# EasyEDA Pro project ProPrj_国赛底层板子_2026-05-31.epro, board 1-PCB_pcb2
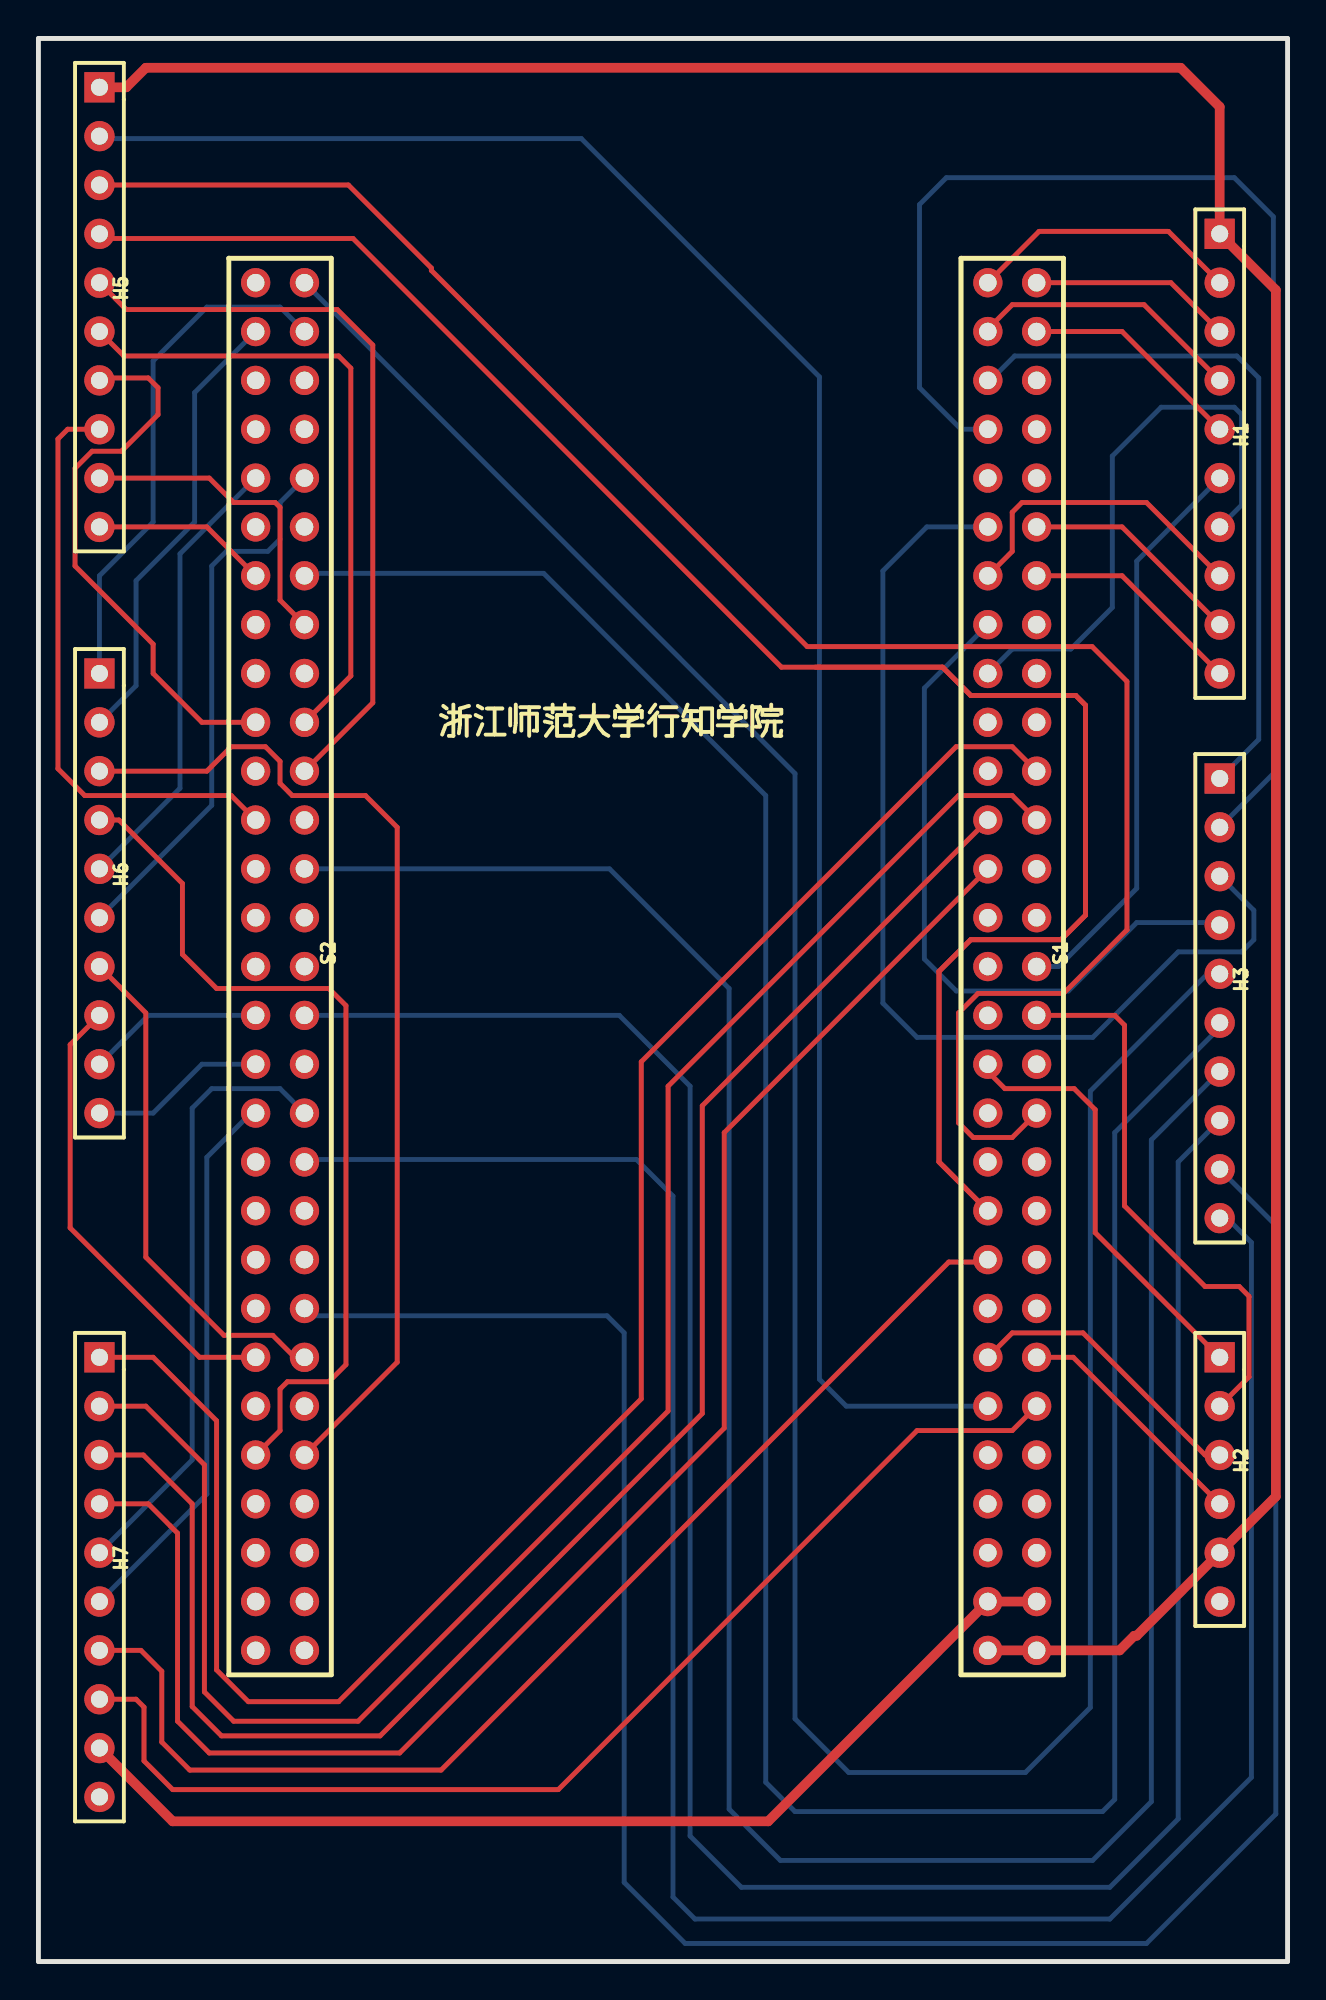
[diagram p9: board, top side]
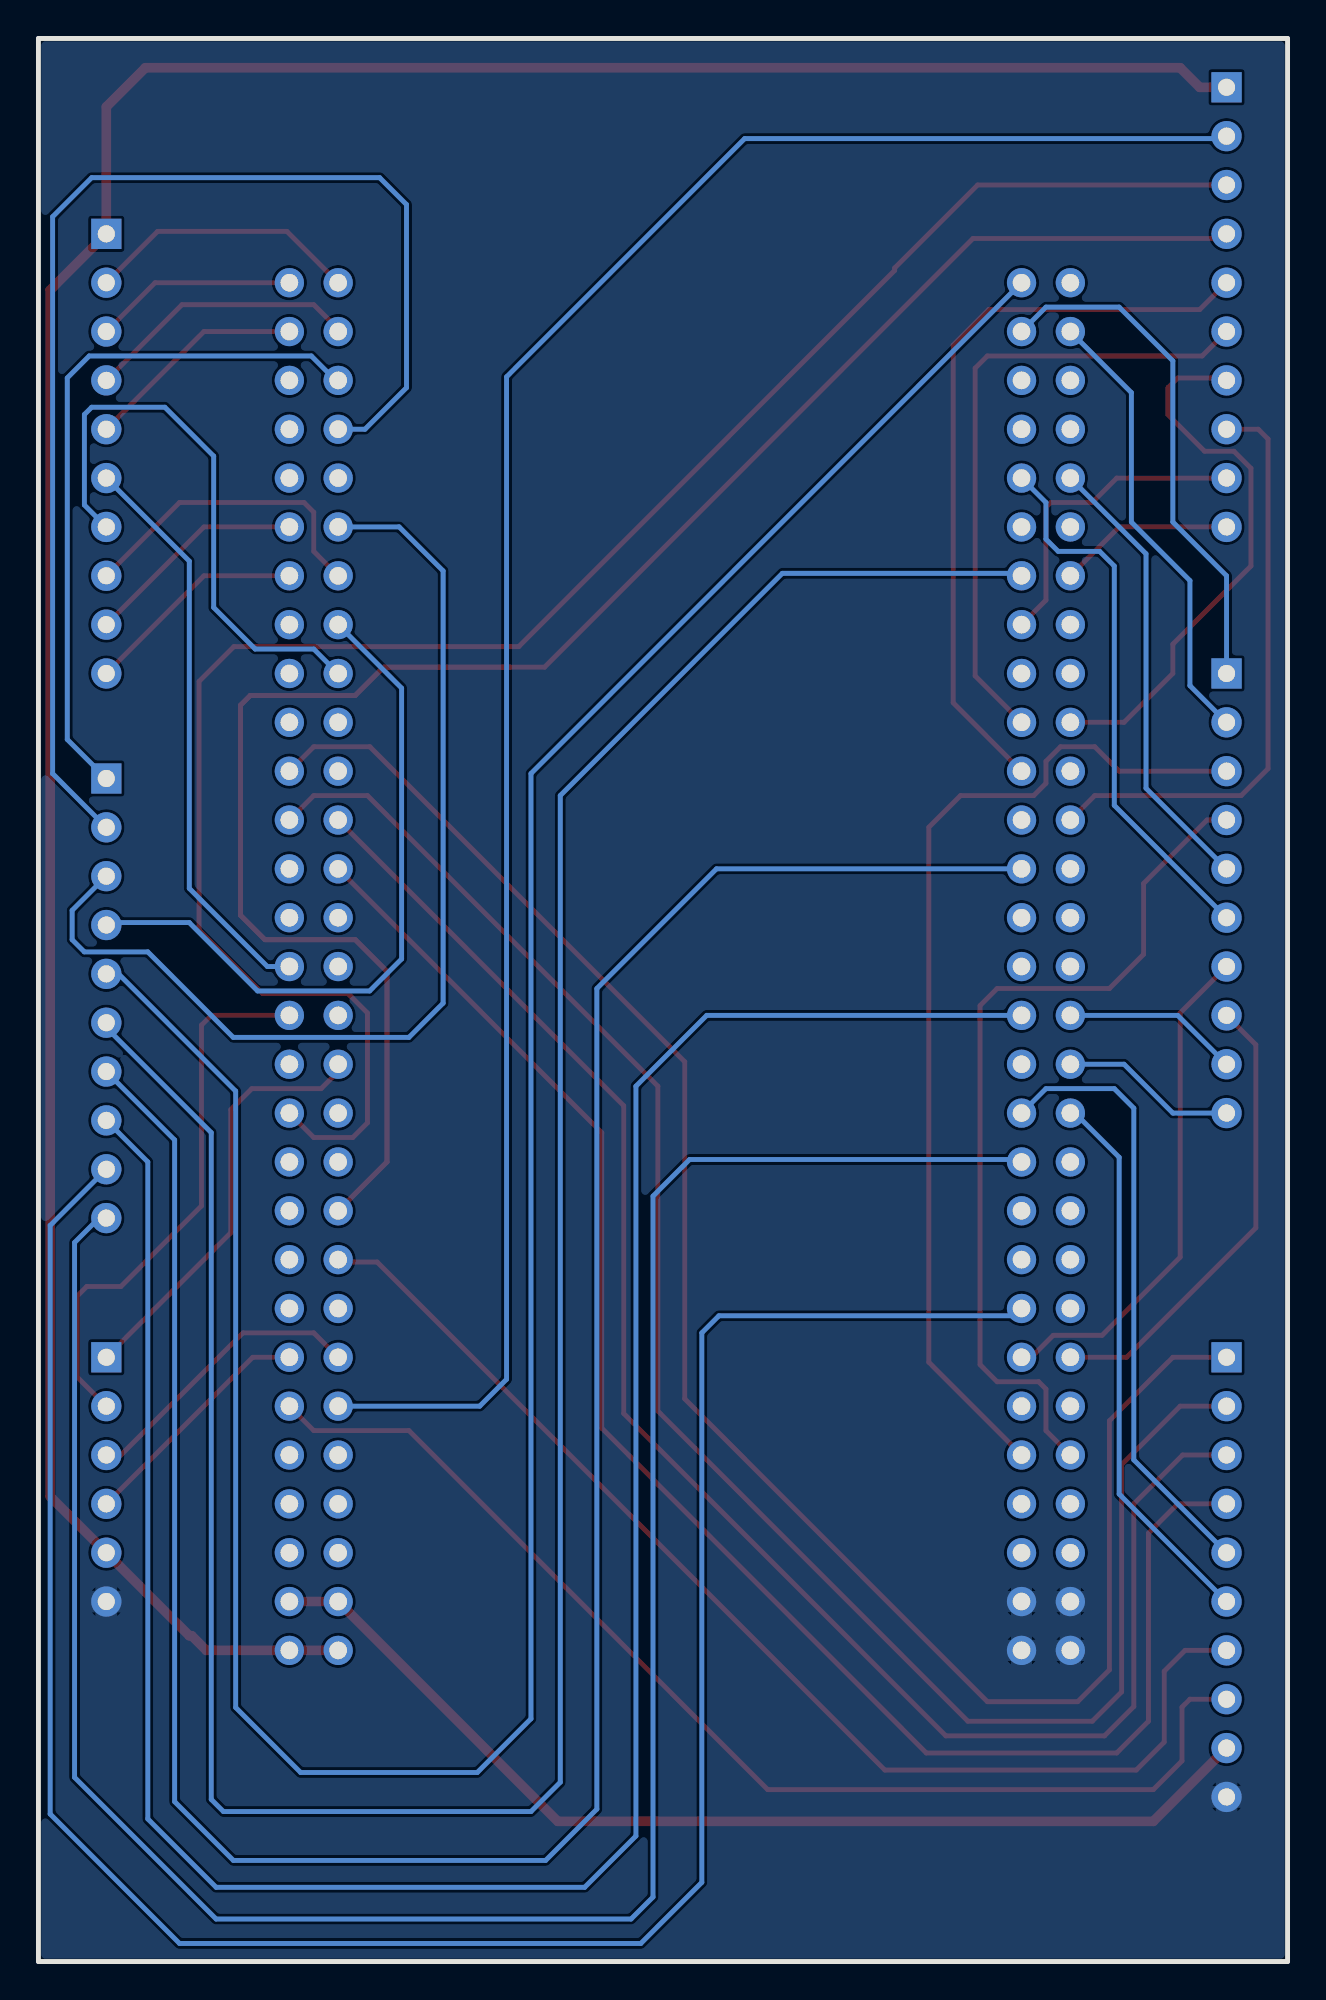
[diagram p10: board, bottom side, seen from below]

Outline 65 x 100 mm; copper layers: Top Layer, Bottom Layer. Coordinates in mm from the lower left corner of the outline.
Outline path: 0,100 65,100 65,0 0,0 0,100

## Design rules (mm)
spacing Default (default): track to track 0.152, other pairs 0 to 0.152
track width Default (default): min 0.254, default 0.254, max 25.4
via Default (default): diameter min 0.61, default 0.61, max 100.025; hole min 0.305, default 0.305, max 59.995
pour e141 uses gge7141
pour e143 uses gge7141

## Placement (name value [footprint] x y rotation side)
H1  HDR-F-2.54_1x10  [HDR-F-2.54_1X10]  61.47 78.41 270 top
H2  HDR-F-2.54_1x6  [HDR-F-2.54_1X6]  61.47 26.34 270 top
H3  HDR-F-2.54_1x10  [HDR-F-2.54_1X10]  61.47 50.09 270 top
H5  HDR-F-2.54_1x10  [HDR-F-2.54_1X10]  3.17 86.03 270 top
H6  HDR-F-2.54_1x10  [HDR-F-2.54_1X10]  3.17 55.55 270 top
H7  HDR-F-2.54_1x10  [HDR-F-2.54_1X10]  3.17 19.99 270 top
S1  双排29脚排针  [双排二十九]  50.67 51.74 270 top
S2  双排29脚排针  [双排二十九]  12.57 51.74 270 top

## Footprints (pads in the part's own frame, mm; a bottom-side part is the same pattern mirrored in y, then rotated)
HDR-F-2.54_1X6
  rect 1.575x1.575 hole 0.889: 1(-5.08,0)
  round 1.575 hole 0.889: 2(-2.54,0) 3(0,0) 4(2.54,0) 5(5.08,0) 6(7.62,0)
HDR-F-2.54_1X10
  rect 1.575x1.575 hole 0.889: 1(-11.43,0)
  round 1.575 hole 0.889: 2(-8.89,0) 3(-6.35,0) 4(-3.81,0) 5(-1.27,0) 6(1.27,0) 7(3.81,0) 8(6.35,0) 9(8.89,0) 10(11.43,0)
双排二十九
  round 1.524 hole 0.914: 1(-35.56,1.27) 2(-33.02,1.27) 3(-30.48,1.27) 4(-27.94,1.27) 5(-25.4,1.27) 6(-22.86,1.27) 7(-20.32,1.27) 8(-17.78,1.27) 9(-15.24,1.27) 10(-12.7,1.27) 11(-10.16,1.27) 12(-7.62,1.27) 13(-5.08,1.27) 14(-2.54,1.27) 15(0,1.27) 16(2.54,1.27) 17(5.08,1.27) 18(7.62,1.27) 19(10.16,1.27) 20(12.7,1.27) 21(15.24,1.27) 22(17.78,1.27) 23(20.32,1.27) 24(22.86,1.27) 25(25.4,1.27) 26(27.94,1.27) 27(30.48,1.27) 28(33.02,1.27) 29(35.56,1.27) 30(35.56,-1.27) 31(33.02,-1.27) 32(30.48,-1.27) 33(27.94,-1.27) 34(25.4,-1.27) 35(22.86,-1.27) 36(20.32,-1.27) 37(17.78,-1.27) 38(15.24,-1.27) 39(12.7,-1.27) 40(10.16,-1.27) 41(7.62,-1.27) 42(5.08,-1.27) 43(2.54,-1.27) 44(0,-1.27) 45(-2.54,-1.27) 46(-5.08,-1.27) 47(-7.62,-1.27) 48(-10.16,-1.27) 49(-12.7,-1.27) 50(-15.24,-1.27) 51(-17.78,-1.27) 52(-20.32,-1.27) 53(-22.86,-1.27) 54(-25.4,-1.27) 55(-27.94,-1.27) 56(-30.48,-1.27) 57(-33.02,-1.27) 58(-35.56,-1.27)

## Nets
As in the schematic.

## Routing (per net, layer and track width the routed paths; a pad name or vN(x,y) marks a point on that pad's centre or on a via; arc(x,y) is an arc through that point)
3V3: length 55.1
  Top Layer w0.5: H7.9 6.98,7.29 37.97,7.29 S1.31 S1.28
5V: length 151.3
  Top Layer w0.5: S1.30 S1.29 56.26,16.18 57.02,16.94 57.15,16.94 H2.5 64.39,24.18 64.39,86.92 H1.1 61.47,96.44 59.44,98.48 5.59,98.48 4.57,97.46 H5.1
A0: length 28.5
  Bottom Layer w0.254: S2.5 12.57,75.87 12.57,73.97 11.94,73.33 9.78,73.33 9.02,72.57 9.02,60.12 H6.6
A1: length 23.7
  Bottom Layer w0.254: S2.54 7.37,73.2 7.37,61.01 H6.5
A5: length 33.6
  Top Layer w0.254: H5.6 4.44,83.49 15.62,83.49 16.26,82.86 16.26,66.85 S2.10
  Bottom Layer w0.254: 2.79,85.01 2.54,84.76
A6: length 28.9
  Top Layer w0.254: H5.7 3.3,82.35 5.72,82.35 6.22,81.84 6.22,80.44 4.32,78.54 2.79,78.54 1.91,77.65 1.91,72.57 5.97,68.5 5.97,66.98 8.51,64.44 S2.49
A7: length 39.2
  Top Layer w0.254: H5.5 4.57,85.9 15.55,85.9 17.4,84.05 17.4,65.46 S2.11
B0: length 16.7
  Top Layer w0.254: S2.8 12.57,70.79 12.57,75.62 12.32,75.87 10.16,75.87 8.89,77.14 H5.9
B1: length 9.2
  Top Layer w0.254: H5.10 8.76,74.6 S2.52
B4: length 85.4
  Top Layer w0.254: H7.4 5.72,23.8 7.24,22.28 7.24,12.5 8.89,10.85 18.8,10.85 35.69,27.74 35.69,43.1 S1.46
B5: length 92.8
  Top Layer w0.254: S1.12 50.67,60.63 47.88,60.63 32.77,45.52 32.77,28.63 16.64,12.5 10.16,12.5 8.64,14.02 8.64,25.83 5.59,28.88 H7.2
B6: length 87.6
  Top Layer w0.254: H7.3 5.46,26.34 8,23.8 8,13.26 9.53,11.74 17.78,11.74 34.54,28.5 34.54,44.5 S1.47
B7: length 95.1
  Top Layer w0.254: S1.11 50.67,63.17 47.75,63.17 31.37,46.79 31.37,29.26 15.62,13.51 10.92,13.51 9.27,15.16 9.27,28.12 5.97,31.42 H7.1
B10: length 120.1
  Bottom Layer w0.254: 61.47,38.66 61.85,38.66 63.12,37.39 63.12,9.58 55.75,2.21 34.16,2.21 33.02,3.35 33.02,39.8 31.12,41.71 13.97,41.71 S2.19
B12: length 24.1
  Top Layer w0.254: H6.8 1.65,47.68 1.65,38.15 8.38,31.42 S2.36
B13: length 26.5
  Top Layer w0.254: S2.23 13.34,31.42 12.19,32.56 9.65,32.56 5.59,36.63 5.59,49.33 H6.7
C0: length 23.7
  Bottom Layer w0.254: S2.57 8.13,81.58 8.13,74.85 5.08,71.81 5.08,66.34 H6.2
C1: length 27
  Bottom Layer w0.254: H6.1 3.17,72.06 5.97,74.85 5.97,83.24 8.76,86.03 12.57,86.03 S2.2
C3: length 144.5
  Bottom Layer w0.254: H3.5 60.83,51.36 54.74,45.26 54.74,13.21 51.36,9.83 42.16,9.83 39.37,12.62 39.37,61.77 S2.1
C6: length 104.1
  Bottom Layer w0.254: S1.35 42.04,28.88 40.64,30.28 40.64,82.4 28.25,94.79 3.3,94.79 H5.2
C7: length 60.6
  Top Layer w0.254: H7.8 5.08,13.64 5.49,13.23 5.49,10.43 6.98,8.94 27.05,8.94 45.72,27.61 50.67,27.61 S1.24
C8: length 15.2
  Top Layer w0.254: S1.36 50.67,32.69 54.36,32.69 60.71,26.34 H2.3
C9: length 12.7
  Top Layer w0.254: S1.23 53.85,31.42 H2.4
C10: length 62
  Top Layer w0.254: S1.38 49.28,36.37 47.37,36.37 20.96,9.96 7.87,9.96 6.42,11.41 6.42,15.1 5.33,16.18 H7.7
C12: length 142.8
  Top Layer w0.254: 47.04,67.31 48.51,65.84 ; 47.04,67.31 48.51,65.84 ; 47.04,67.31 38.66,67.31 16.37,89.6 3.42,89.6 H5.4 ; 47.04,67.31 40.44,67.31 ; 48.51,65.84 53.97,65.84 ; 48.51,65.84 53.97,65.84 ; 54.48,54.41 53.21,53.14 ; 54.48,54.41 54.48,65.33 ; 54.48,54.41 54.48,65.33 ; 54.48,54.41 53.21,53.14 ; 53.21,53.14 48.51,53.14 ; 53.21,53.14 48.51,53.14 ; 53.97,65.84 54.48,65.33 ; 53.97,65.84 54.48,65.33 ; 48.51,53.14 46.86,51.49 ; 48.51,53.14 46.86,51.49 ; 46.86,51.49 46.86,41.58 ; 46.86,51.49 46.86,41.58 ; 46.86,41.58 S1.39 46.86,41.58
D2: length 98.3
  Top Layer w0.254: S1.18 50.67,42.85 48.64,42.85 47.88,43.61 47.88,49.33 48.9,50.34 53.34,50.34 56.64,53.64 56.64,66.56 54.83,68.38 40,68.38 20.45,87.94 20.45,88.06 16.13,92.38 H5.3
D5: length 22.3
  Top Layer w0.254: S1.42 49.4,46.28 50.29,45.39 53.9,45.39 54.99,44.3 54.99,37.9 H2.1
D6: length 29
  Top Layer w0.254: H2.2 62.99,30.4 62.99,34.59 62.48,35.1 60.71,35.1 56.51,39.29 56.51,48.69 56.01,49.2 S1.16
D8: length 45.6
  Top Layer w0.254: H6.4 4.19,59.36 7.49,56.06 7.49,52.38 9.27,50.6 15.11,50.6 16,49.71 16,31.04 15.11,30.15 12.95,30.15 12.57,29.77 12.57,27.61 S2.34
D9: length 53.1
  Top Layer w0.254: S2.25 18.67,31.17 18.67,58.98 17.02,60.63 13.21,60.63 12.57,61.27 12.57,62.41 11.81,63.17 10.03,63.17 8.76,61.9 H6.3
D14: length 118.5
  Bottom Layer w0.254: S2.22 14.22,33.58 29.59,33.58 30.48,32.69 30.48,4.12 33.66,0.94 57.66,0.94 64.39,7.67 64.39,38.28 H3.9
E2: length 11.6
  Top Layer w0.254: S1.7 56.39,72.06 H1.10
E3: length 16.4
  Top Layer w0.254: H1.8 57.66,75.87 51.18,75.87 50.67,75.36 50.67,73.33 S1.52
E4: length 11.6
  Top Layer w0.254: H1.9 56.39,74.6 S1.6
E5: length 55.1
  Bottom Layer w0.254: H3.3 63.25,54.66 63.25,53.14 62.61,52.5 59.31,52.5 54.86,48.06 45.72,48.06 43.94,49.83 43.94,72.31 46.23,74.6 S1.53
E9: length 9.4
  Bottom Layer w0.254: H6.9 5.72,49.2 S2.43 ; 2.67,46.79 2.54,46.66
E10: length 125.8
  Bottom Layer w0.254: H3.8 59.31,41.58 59.31,7.42 55.75,3.86 36.58,3.86 33.91,6.53 33.91,45.52 30.23,49.2 S2.16
E11: length 9.2
  Bottom Layer w0.254: H6.10 5.97,44.12 8.51,46.66 S2.42
E13: length 28.9
  Bottom Layer w0.254: H7.6 8.76,24.31 8.76,41.82 11.06,44.12 S2.41
E14: length 31.9
  Bottom Layer w0.254: S2.18 12.57,45.39 9.02,45.39 8,44.37 8,26.09 H7.5
F0: length 66.7
  Bottom Layer w0.254: S1.55 48.01,79.68 45.85,81.84 45.85,91.36 47.24,92.76 62.23,92.76 64.26,90.73 64.26,61.77 H3.2
F2: length 36.8
  Bottom Layer w0.254: S1.56 49.53,82.22 50.8,83.49 62.36,83.49 63.5,82.35 63.5,63.55 H3.1
F3: length 11.6
  Top Layer w0.254: H1.5 56.39,84.76 S1.2
F4: length 14.3
  Top Layer w0.254: S1.57 49.4,84.89 50.67,86.16 57.53,86.16 H1.4
F5: length 10.6
  Top Layer w0.254: H1.3 58.93,87.3 S1.1
F6: length 14.3
  Top Layer w0.254: S1.58 52.07,89.97 58.8,89.97 H1.2
F11: length 30.9
  Top Layer w0.254: S2.47 10.03,60.63 2.41,60.63 1.02,62.03 1.02,79.17 1.52,79.68 H5.8
F12: length 131.1
  Bottom Layer w0.254: S2.13 29.72,56.82 35.94,50.6 35.94,7.93 38.61,5.26 54.86,5.26 57.91,8.31 57.91,42.72 H3.7
F13: length 141.9
  Bottom Layer w0.254: S2.7 13.97,72.19 26.29,72.19 37.85,60.63 37.85,9.32 39.37,7.8 55.37,7.8 56.01,8.43 56.01,43.1 61.47,48.56 H3.6
G9: length 30
  Bottom Layer w0.254: H1.6 57.15,72.82 57.15,55.8 53.09,51.74 S1.15
G12: length 36.3
  Bottom Layer w0.254: S1.51 46.1,66.22 46.1,52.13 47.76,50.47 53.59,50.47 57.15,54.03 61.34,54.03 H3.4
G14: length 30
  Bottom Layer w0.254: S1.50 50.67,68.25 53.72,68.25 55.88,70.41 55.88,78.28 58.42,80.82 62.23,80.82 62.61,80.44 62.61,75.74 H1.7

## Copper pours and planes (outline as drawn; the poured copper is in the pictures)
GND on Bottom Layer: -1.65,104.57 -2.41,103.81 -2.41,110.41 -1.65,109.65
GND on Bottom Layer: 65.15,-11.25 57.53,-3.63 -9.02,-3.63 -1.65,3.73 -1.65,104.57 -0.13,106.1 74.55,106.1 65.15,96.95

## Text on the board
Top Silkscreen Layer: 浙江师范大学行知学院
